# Altium schematic sheet Sensors.SchDoc
size A4; SheetNumber: 7; SheetTotal: 7
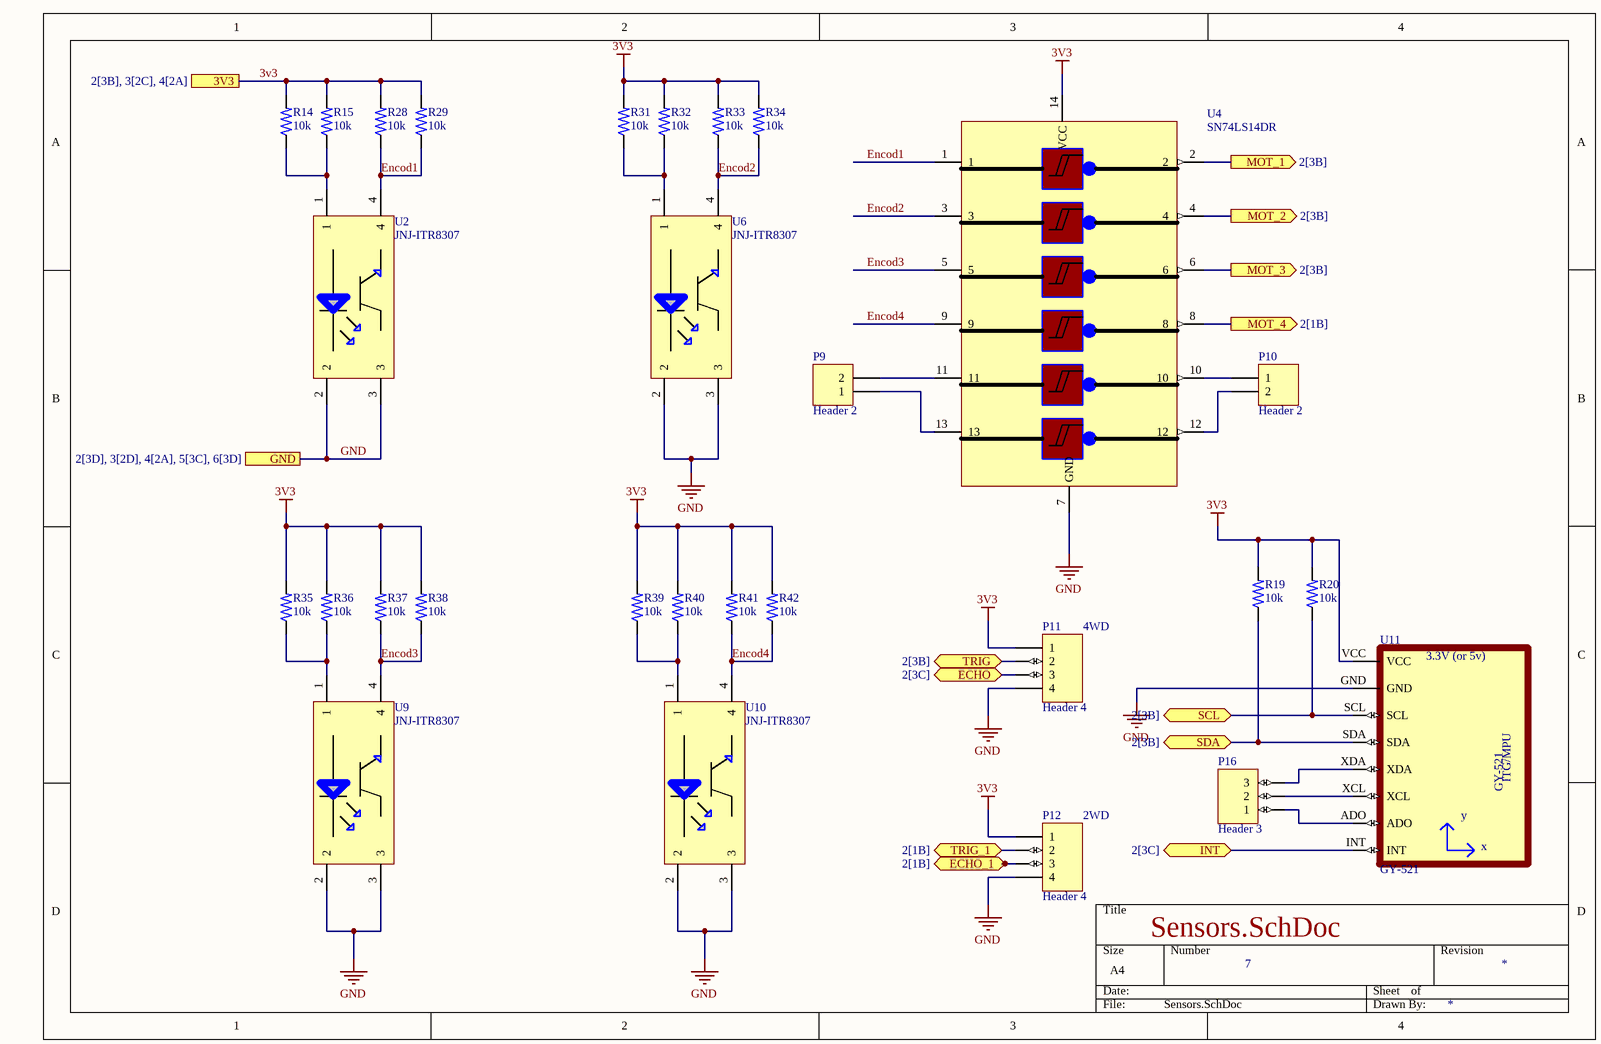
[diagram p0: Sensors.SchDoc]

## Parts
P9  Header 2  [HDR1X2]
P10  Header 2  [HDR1X2]
P11  Header 4  [HDR1X4]
P12  Header 4  [HDR1X4]
P16  Header 3  [HDR1X3]
R14  10k  [RESC3115X65N]
R15  10k  [RESC3115X65N]
R19  10k  [RESC3115X65N]
R20  10k  [RESC3115X65N]
R28  10k  [RESC3115X65N]
R29  10k  [RESC3115X65N]
R31  10k  [RESC3115X65N]
R32  10k  [RESC3115X65N]
R33  10k  [RESC3115X65N]
R34  10k  [RESC3115X65N]
R35  10k  [RESC3115X65N]
R36  10k  [RESC3115X65N]
R37  10k  [RESC3115X65N]
R38  10k  [RESC3115X65N]
R39  10k  [RESC3115X65N]
R40  10k  [RESC3115X65N]
R41  10k  [RESC3115X65N]
R42  10k  [RESC3115X65N]
U2  JNJ-ITR8307  [JNJ-ITR8307]
U4  SN74LS14DR  [SOP127P602X175-14N]
U6  JNJ-ITR8307  [JNJ-ITR8307]
U9  JNJ-ITR8307  [JNJ-ITR8307]
U10  JNJ-ITR8307  [JNJ-ITR8307]
U11  GY-521  [GY-521]

## Ports
3V3 (see 2[3B], 3[2C], 4[2A]), ECHO (bidir, see 2[3C]), ECHO_1 (bidir, see 2[1B]), GND (see 2[3D], 3[2D], 4[2A], 5[3C], 6[3D]), INT (bidir, see 2[3C]), MOT_1 (out, see 2[3B]), MOT_2 (out, see 2[3B]), MOT_3 (out, see 2[3B]), MOT_4 (out, see 2[1B]), SCL (bidir, see 2[3B]), SDA (bidir, see 2[3B]), TRIG (bidir, see 2[3B]), TRIG_1 (bidir, see 2[1B])

## Nets
3v3: P11.1 P12.1 R14.2 R15.2 R19.2 R20.2 R28.2 R29.2 R31.2 R32.2 R33.2 R34.2 R35.2 R36.2 R37.2 R38.2 R39.2 R40.2 R41.2 R42.2 U4.14(VCC) U11.VCC ; port 3V3
GND: P11.4 P12.4 U2.2 U2.3 U4.7(GND) U6.2 U6.3 U9.2 U9.3 U10.2 U10.3 U11.GND ; port GND
ECHO: P11.3 ; port ECHO
ECHO_1: P12.3 ; port ECHO_1
Encod1: R28.1 R29.1 U2.4 U4.1
Encod2: R33.1 R34.1 U4.3 U6.4
Encod3: R37.1 R38.1 U4.5 U9.4
Encod4: R41.1 R42.1 U4.9 U10.4
INT: U11.INT ; port INT
MOT_1: U4.2 ; port MOT_1
MOT_2: U4.4 ; port MOT_2
MOT_3: U4.6 ; port MOT_3
MOT_4: U4.8 ; port MOT_4
SCL: R20.1 U11.SCL ; port SCL
SDA: R19.1 U11.SDA ; port SDA
TRIG: P11.2 ; port TRIG
TRIG_1: P12.2 ; port TRIG_1
NetP9_1: P9.1 U4.13
NetP9_2: P9.2 U4.11
NetP10_1: P10.1 U4.10
NetP10_2: P10.2 U4.12
NetP16_1: P16.1 U11.ADO
NetP16_2: P16.2 U11.XCL
NetP16_3: P16.3 U11.XDA
NetR14_1: R14.1 R15.1 U2.1
NetR31_1: R31.1 R32.1 U6.1
NetR35_1: R35.1 R36.1 U9.1
NetR39_1: R39.1 R40.1 U10.1

## Notes on the sheet
- (near P11) 4WD
- (near P12) 2WD
- (in symbol GY-521) 3.3V (or 5v); ITG/MPU; y; x

## Library data of the parts
P9 P10 = Header 2: Header, 2-Pin; LatestRevisionDate: 17-Jul-2002; LatestRevisionNote: Re-released for DXP Platform.; Publisher: Altium Limited
P11 P12 = Header 4: Header, 4-Pin; LatestRevisionDate: 17-Jul-2002; LatestRevisionNote: Re-released for DXP Platform.; Publisher: Altium Limited
P16 = Header 3: Header, 3-Pin; LatestRevisionDate: 17-Jul-2002; LatestRevisionNote: Re-released for DXP Platform.; Publisher: Altium Limited
R14 R15 R19 R20 R28 R29 R31-R42 = 1-1879462-4: RL73H 2B R43 1% 5K RL; MF: {'manufacturer': u'TE Connectivity'}; Package: None; Price: None; Value: *; MP: 1-1879462-4; Availability: Unavailable
U2 U6 U9 U10 = JNJ-ITR8307: SMD-4P,3.4x2.7mm Reflective Optical Interrupters ROHS
U4 = SN74LS14DR: Schmitt Trigger 6 21ns@6V 2uA 2V~6V SOP-14 Inverters ROHS
U11 = GY-521: Triple Axis Accelerometer Gyro Breakout; MF: GODREAM FORDREAM CO., LIMITED; Price: None; MP: GY-521; SnapEDA_Link: https://www.snapeda.com/parts/GY-521/GODREAM+FORDREAM+CO.%252C+LIMITED/view-part/?ref=snap; Package: Package; Availability: Not in stock; Check_prices: https://www.snapeda.com/parts/GY-521/GODREAM+FORDREAM+CO.%252C+LIMITED/view-part/?ref=eda; Value: *